# Altium schematic sheet IO_Devices.SchDoc
size A; SheetNumber: 4; SheetTotal: 5
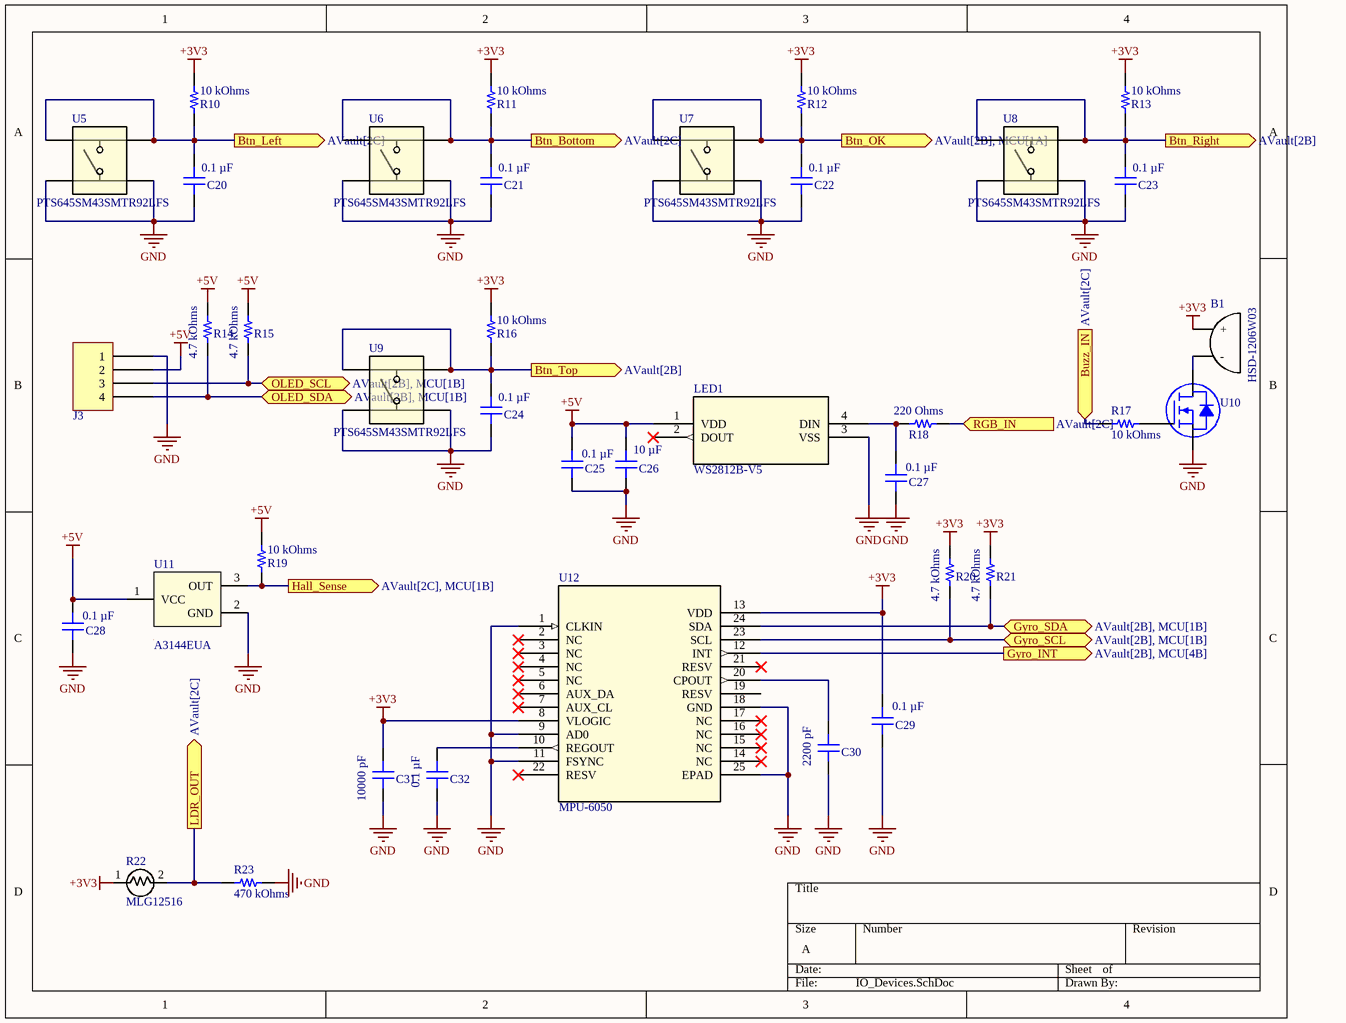
[diagram p0: IO_Devices.SchDoc]

## Parts
B1  HSD-1206W03  [HSD-1206W03]
C20  0.1 µF  [CAP 0603_1608]
C21  0.1 µF  [CAP 0603_1608]
C22  0.1 µF  [CAP 0603_1608]
C23  0.1 µF  [CAP 0603_1608]
C24  0.1 µF  [CAP 0603_1608]
C25  0.1 µF  [CAP 0603_1608]
C26  10 µF  [CAP 0805_2012]
C27  0.1 µF  [CAP 0603_1608]
C28  0.1 µF  [CAP 0603_1608]
C29  0.1 µF  [CAP 0603_1608]
C30  2200 pF  [CAP 0603_1608]
C31  10000 pF  [CAP 0603_1608]
C32  0.1 µF  [CAP 0603_1608]
J3  0022272041  [MOLEX KK 0022272041]  (value not drawn)
LED1  WS2812B-V5  [WS2812B-V5]
R10  10 kOhms  [RES 0805_2012]
R11  10 kOhms  [RES 0805_2012]
R12  10 kOhms  [RES 0805_2012]
R13  10 kOhms  [RES 0805_2012]
R14  4.7 kOhms  [RES 0805_2012]
R15  4.7 kOhms  [RES 0805_2012]
R16  10 kOhms  [RES 0805_2012]
R17  10 kOhms  [RES 0805_2012]
R18  220 Ohms  [RES 0603_1608]
R19  10 kOhms  [RES 0805_2012]
R20  4.7 kOhms  [RES 0805_2012]
R21  4.7 kOhms  [RES 0805_2012]
R22  MLG12516  [MLG12516]
R23  470 kOhms  [RES 0805_2012]
U5  PTS645SM43SMTR92LFS  [SWITCH_43SMTR92LFS]
U6  PTS645SM43SMTR92LFS  [SWITCH_43SMTR92LFS]
U7  PTS645SM43SMTR92LFS  [SWITCH_43SMTR92LFS]
U8  PTS645SM43SMTR92LFS  [SWITCH_43SMTR92LFS]
U9  PTS645SM43SMTR92LFS  [SWITCH_43SMTR92LFS]
U10  2N7002A-7  [DIODES SOT-23-3]  (value not drawn)
U11  A3144EUA  [A3144EUA]
U12  MPU-6050  [QFN24_4X4X0P9-0P5_TDK]

## Ports
Btn_Bottom (out, see AVault[2C]), Btn_Left (out, see AVault[2C]), Btn_OK (out, see AVault[2B], MCU[1A]), Btn_Right (out, see AVault[2B]), Btn_Top (out, see AVault[2B]), Buzz_IN (in, see AVault[2C]), Gyro_INT (out, see AVault[2B], MCU[4B]), Gyro_SCL (bidir, see AVault[2B], MCU[1B]), Gyro_SDA (bidir, see AVault[2B], MCU[1B]), Hall_Sense (out, see AVault[2C], MCU[1B]), LDR_OUT (out, see AVault[2C]), OLED_SCL (bidir, see AVault[2B], MCU[1B]), OLED_SDA (bidir, see AVault[2B], MCU[1B]), RGB_IN (in, see AVault[2C])

## Nets
+3V3: B1.1(+) C29.2 C31.2 R10.2 R11.2 R12.2 R13.2 R16.2 R20.2 R21.2 R22.1 U12.8(VLOGIC) U12.13(VDD)
+5V: C25.2 C26.2 C28.2 J3.2 LED1.1(VDD) R14.2 R15.2 R19.2 U11.1(VCC)
GND: C20.1 C21.1 C22.1 C23.1 C24.1 C25.1 C26.1 C27.1 C28.1 C29.1 C30.1 C31.1 C32.1 J3.1 LED1.3(VSS) R23.1 U5.3 U5.4 U6.3 U6.4 U7.3 U7.4 U8.3 U8.4 U9.3 U9.4 U10.2(S) U11.2(GND) U12.1(CLKIN) U12.9(AD0) U12.11(FSYNC) U12.18(GND) U12.25(EPAD)
Btn_Bottom: C21.2 R11.1 U6.1 U6.2 ; port Btn_Bottom
Btn_Left: C20.2 R10.1 U5.1 U5.2 ; port Btn_Left
Btn_OK: C22.2 R12.1 U7.1 U7.2 ; port Btn_OK
Btn_Right: C23.2 R13.1 U8.1 U8.2 ; port Btn_Right
Btn_Top: C24.2 R16.1 U9.1 U9.2 ; port Btn_Top
Buzz_IN: R17.2 ; port Buzz_IN
Gyro_INT: U12.12(INT) ; port Gyro_INT
Gyro_SCL: R20.1 U12.23(SCL) ; port Gyro_SCL
Gyro_SDA: R21.1 U12.24(SDA) ; port Gyro_SDA
Hall_Sense: R19.1 U11.3(OUT) ; port Hall_Sense
LDR_OUT: R22.2 R23.2 ; port LDR_OUT
OLED_SCL: J3.3 R15.1 ; port OLED_SCL
OLED_SDA: J3.4 R14.1 ; port OLED_SDA
RGB_IN: R18.1 ; port RGB_IN
NetB1_2: B1.2(-) U10.3(D)
NetC27_2: C27.2 LED1.4(DIN) R18.2
NetC30_2: C30.2 U12.20(CPOUT)
NetC32_2: C32.2 U12.10(REGOUT)
NetR17_1: R17.1 U10.1(G)

Not connected (* = marked no-connect by the designer): LED1 2(DOUT)*; U12 2(NC)* 3(NC)* 4(NC)* 5(NC)* 6(AUX_DA)* 7(AUX_CL)* 14(NC)* 15(NC)* 16(NC)* 17(NC)* 19(RESV) 21(RESV)* 22(RESV)*

## Library data of the parts
B1 = HSD-1206W03: BUZZER MAGNETIC 3V 12MM TH
C20-C25 C27-C29 C32 = GRM188R72A104KA35D: CAP CER 0.1UF 100V X7R 0603; Manufacturer: Murata Electronics; id: 1738; Tolerance: ±10%; Part Number: GRM188R72A104KA35D; Value: 0.1 µF; Temperature Coefficient: X7R; Supplier Part Number 1: 490-3285-1-ND; ComponentLink2Description: DigiKey Link; ComponentLink1URL: https:\\www.murata.com\~\media\webrenewal\support\library\catalog\products\capacitor\mlcc\c02e.ashx?la=en-us; PartId: 9563; Supplier 1: DigiKey; Series: GRM; LastUpdated: 2023-01-03T20:07:27.117; Part Status: Active; Capacitance: 0.1 µF; Device Package: 0603 (1608 Metric); Thickness (Max): 0.035" (0.90mm); Voltage - Rated: 100V; Minimum Order: 1; Packaging: TapeAndReel; Applications: General Purpose; Package / Case: 0603 (1608 Metric); ComponentLink1Description: Datasheet; Price: 0.02; ComponentLink2URL: https:\\www.digikey.com\en\products\detail\murata-electronics\GRM188R72A104KA35D\702549; Lifecycle Status: Active; Operating Temperature: -55°C ~ 125°C; Size / Dimension: 0.063" L x 0.031" W (1.60mm x 0.80mm); Mounting Type: Surface Mount, MLCC
C26 = C2012X5R1V106K125AC: CAP CER 10UF 35V X5R 0805; Manufacturer: TDK Corporation; id: 6404; Tolerance: ±10%; Value: 10 µF; Temperature Coefficient: X5R; Part Number: C2012X5R1V106K125AC; Supplier Part Number 1: 445-14418-1-ND; ComponentLink2Description: DigiKey Link; Features: Low ESL; ComponentLink1URL: https:\\product.tdk.com\info\en\catalog\datasheets\mlcc_commercial_general_en.pdf?ref_disty=digikey; PartId: 40531; Supplier 1: DigiKey; Series: C; LastUpdated: 2023-01-03T20:10:34.680; Part Status: Active; Capacitance: 10 µF; Device Package: 0805 (2012 Metric); Thickness (Max): 0.057" (1.45mm); Voltage - Rated: 35V; Minimum Order: 1; Packaging: TapeAndReel; Applications: General Purpose; Package / Case: 0805 (2012 Metric); ComponentLink1Description: Datasheet; Price: 0.14; ComponentLink2URL: https:\\www.digikey.com\en\products\detail\tdk-corporation\C2012X5R1V106K125AC\3951654; Lifecycle Status: Active; Operating Temperature: -55°C ~ 85°C; Size / Dimension: 0.079" L x 0.049" W (2.00mm x 1.25mm); Mounting Type: Surface Mount, MLCC
C30 = C1608NP02A222J080AA: CAP CER 2200PF 100V NP0 0603; Manufacturer: TDK Corporation; id: 7609; Temperature Coefficient: C0G, NP0; Tolerance: ±5%; Part Number: C1608NP02A222J080AA; Value: 2200 pF; Supplier Part Number 1: 445-15272-1-ND; ComponentLink2Description: DigiKey Link; Features: High Temperature; ComponentLink1URL: https:\\product.tdk.com\info\en\catalog\datasheets\mlcc_commercial_hightemp_en.pdf?ref_disty=digikey; PartId: 40621; Supplier 1: DigiKey; Series: C; LastUpdated: 2023-01-03T20:07:16.653; Part Status: Active; Capacitance: 2200 pF; Device Package: 0603 (1608 Metric); Thickness (Max): 0.035" (0.90mm); Voltage - Rated: 100V; Minimum Order: 1; Packaging: TapeAndReel; Applications: General Purpose; Package / Case: 0603 (1608 Metric); ComponentLink1Description: Datasheet; Price: 0.04; ComponentLink2URL: https:\\www.digikey.com\en\products\detail\tdk-corporation\C1608NP02A222J080AA\4278005; Lifecycle Status: Active; Operating Temperature: -55°C ~ 150°C; Size / Dimension: 0.063" L x 0.031" W (1.60mm x 0.80mm); Mounting Type: Surface Mount, MLCC
C31 = C1608NP01H103J080AA: CAP CER 10000PF 50V NP0 0603; Manufacturer: TDK Corporation; id: 2977; Temperature Coefficient: C0G, NP0; Tolerance: ±5%; Part Number: C1608NP01H103J080AA; Value: 10000 pF; Supplier Part Number 1: 445-14056-1-ND; ComponentLink2Description: DigiKey Link; Features: High Temperature; ComponentLink1URL: https:\\product.tdk.com\info\en\catalog\datasheets\mlcc_commercial_hightemp_en.pdf?ref_disty=digikey; PartId: 14361; Supplier 1: DigiKey; Series: C; LastUpdated: 2023-01-03T20:07:13.587; Part Status: Active; Capacitance: 10000 pF; Device Package: 0603 (1608 Metric); Thickness (Max): 0.035" (0.90mm); Voltage - Rated: 50V; Minimum Order: 1; Packaging: TapeAndReel; Applications: General Purpose; Package / Case: 0603 (1608 Metric); ComponentLink1Description: Datasheet; Price: 0.07; ComponentLink2URL: https:\\www.digikey.com\en\products\detail\tdk-corporation\C1608NP01H103J080AA\3951292; Lifecycle Status: Active; Operating Temperature: -55°C ~ 150°C; Size / Dimension: 0.063" L x 0.031" W (1.60mm x 0.80mm); Mounting Type: Surface Mount, MLCC
J3 = 0022272041: CONN HEADER VERT 4POS 2.54MM; Manufacturer: Molex; id: 78; Style: Board to Cable\Wire; Contact Length - Mating: 0.295" (7.49mm); Pitch - Mating: 0.100" (2.54mm); Number Of Positions: 4; Number Of Positions Loaded: All; Shrouding: Shrouded - 1 Wall; Material Flammability Rating: UL94 V-0; Overall Contact Length: 0.560" (14.22mm); Contact Length - Post: 0.140" (3.56mm); Part Number: 0022272041; Supplier Part Number 1: WM4113-ND; Contact Shape: Square; Termination: Solder; ComponentLink1Description: Datasheet; Connector Type: Header; Contact Material: Brass; ComponentLink2URL: http:\\digikey.com\product-detail\en\molex\0022272041\WM4113-ND\1130579; Contact Finish - Mating: Tin; ComponentLink1URL: https:\\www.molex.com\pdm_docs\sd\022272041_sd.pdf; Fastening Type: Friction Lock; Supplier 1: DigiKey; Number Of Rows: 1; Series: KK 6410; Part Status: Active; ComponentLink2Description: DigiKey Link; Contact Type: Male Pin; Packaging: Bulk; Insulation Height: 0.461" (11.70mm); Contact Finish - Post: Tin; Contact Finish Thickness - Mating: 100.0µin (2.54µm); Minimum Order: 1; PartId: 78; Lifecycle Status: Active; LastUpdated: 2020-01-12T23:52:05.287; Insulation Color: Natural; Mounting Type: Through Hole; Insulation Material: Polyamide (PA), Nylon; Price: 0.40
LED1 = WS2812B-V5: ADDRESS LED RED/GRN/BLUE; Manufacturer_Name: Sparkfun; Manufacturer_Part_Number: COM-16347; Type: LED Addressable; Copyright: Copyright (C) 2026 Ultra Librarian. All rights reserved.; RefDes: RefDes
R10-R13 R16 R17 R19 = RNCP0805FTD10K0: RES 10K OHM 1% 1\4W 0805; Manufacturer: Stackpole Electronics Inc; id: 164; Temperature Coefficient: ±100ppm\°C; Power (Watts): 0.25W, 1\4W; Part Number: RNCP0805FTD10K0; Height - Seated (Max): 0.025" (0.65mm); Supplier Part Number 1: RNCP0805FTD10K0CT-ND; Supplier Device Package: 0805; ComponentLink1Description: Datasheet; ComponentLink2URL: https:\\www.digikey.com\en\products\detail\stackpole-electronics-inc\RNCP0805FTD10K0\2240262; Features: Anti-Sulfur; ComponentLink1URL: https:\\www.seielect.com\catalog\sei-rncp.pdf; Composition: Thin Film; Tolerance: ±1%; Supplier 1: DigiKey; Series: RNCP; Part Status: Active; ComponentLink2Description: DigiKey Link; Device Package: 0805 (2012 Metric); Packaging: TapeAndReel; Minimum Order: 1; Package / Case: 0805 (2012 Metric); PartId: 28021; Lifecycle Status: Active; LastUpdated: 2023-01-02T20:44:50.960; Operating Temperature: -55°C ~ 155°C; Number Of Terminations: 2; Value: 10 kOhms; Size / Dimension: 0.079" L x 0.049" W (2.00mm x 1.25mm); Price: 0.01; Resistance: 10 kOhms
R14 R15 R20 R21 = RMCF0805FT4K70: RES 4.7K OHM 1% 1\8W 0805; Manufacturer: Stackpole Electronics Inc; id: 2365; Temperature Coefficient: ±100ppm\°C; Power (Watts): 0.125W, 1\8W; Part Number: RMCF0805FT4K70; Height - Seated (Max): 0.026" (0.65mm); Supplier Part Number 1: RMCF0805FT4K70CT-ND; Supplier Device Package: 0805; ComponentLink1Description: Datasheet; ComponentLink2URL: https:\\www.digikey.com\en\products\detail\stackpole-electronics-inc\RMCF0805FT4K70\1760659; Features: Automotive AEC-Q200; ComponentLink1URL: https:\\www.seielect.com\catalog\sei-rmcf_rmcp.pdf; Composition: Thick Film; Tolerance: ±1%; Supplier 1: DigiKey; Series: RMCF; Part Status: Active; ComponentLink2Description: DigiKey Link; Device Package: 0805 (2012 Metric); Packaging: CutTape; Ratings: AEC-Q200; Minimum Order: 1; Package / Case: 0805 (2012 Metric); PartId: 32422; Lifecycle Status: Active; LastUpdated: 2023-01-02T20:44:32.783; Operating Temperature: -55°C ~ 155°C; Number Of Terminations: 2; Value: 4.7 kOhms; Size / Dimension: 0.079" L x 0.049" W (2.00mm x 1.25mm); Price: 0.01; Resistance: 4.7 kOhms
R18 = RMCF0603FT220R: RES 220 OHM 1% 1\10W 0603; Manufacturer: Stackpole Electronics Inc; id: 593; Temperature Coefficient: ±100ppm\°C; Power (Watts): 0.1W, 1\10W; Part Number: RMCF0603FT220R; Height - Seated (Max): 0.022" (0.55mm); Supplier Part Number 1: RMCF0603FT220RCT-ND; Supplier Device Package: 0603; ComponentLink1Description: Datasheet; ComponentLink2URL: https:\\www.digikey.com\en\products\detail\stackpole-electronics-inc\RMCF0603FT220R\1760809; Features: Automotive AEC-Q200; ComponentLink1URL: https:\\www.seielect.com\catalog\sei-rmcf_rmcp.pdf; Composition: Thick Film; Tolerance: ±1%; Supplier 1: DigiKey; Series: RMCF; Part Status: Active; ComponentLink2Description: DigiKey Link; Device Package: 0603 (1608 Metric); Packaging: CutTape; Ratings: AEC-Q200; Minimum Order: 1; Package / Case: 0603 (1608 Metric); PartId: 6086; Lifecycle Status: Active; LastUpdated: 2023-01-02T20:30:22.033; Operating Temperature: -55°C ~ 155°C; Number Of Terminations: 2; Value: 220 Ohms; Size / Dimension: 0.061" L x 0.031" W (1.55mm x 0.80mm); Price: 0.01; Resistance: 220 Ohms
R22 = MLG12516: CDS PHOTORESISTOR
R23 = CRGP0805F470K: RES 470K OHM 1% 1\3W 0805; Manufacturer: TE Connectivity Passive Product; id: 531; Temperature Coefficient: ±100ppm\°C; Power (Watts): 0.333W, 1\3W; Part Number: CRGP0805F470K; Height - Seated (Max): 0.026" (0.65mm); Supplier Part Number 1: A130509CT-ND; Supplier Device Package: 0805; ComponentLink1Description: Datasheet; ComponentLink2URL: https:\\www.digikey.com\en\products\detail\te-connectivity-passive-product\CRGP0805F470K\8577111; Features: Pulse Withstanding; ComponentLink1URL: https:\\www.te.com\commerce\DocumentDelivery\DDEController?Action=srchrtrv&DocNm=9-1773463-9&DocType=DS&DocLang=English; Composition: Thick Film; Tolerance: ±1%; Supplier 1: DigiKey; Series: CRGP; Part Status: Active; ComponentLink2Description: DigiKey Link; Device Package: 0805 (2012 Metric); Packaging: TapeAndReel; Minimum Order: 1; Package / Case: 0805 (2012 Metric); PartId: 28755; Lifecycle Status: Active; LastUpdated: 2023-01-02T20:44:47.733; Operating Temperature: -55°C ~ 155°C; Number Of Terminations: 2; Value: 470 kOhms; Size / Dimension: 0.079" L x 0.049" W (2.00mm x 1.25mm); Price: 0.02; Resistance: 470 kOhms
U5-U9 = PTS645SM43SMTR92LFS: Description; Manufacturer_Name: C&K Components; Copyright: Copyright (C) 2026 Ultra Librarian. All rights reserved.; Manufacturer_Part_Number: PTS645SM43SMTR92LFS; RefDes: RefDes; Type: Type
U10 = 2N7002A-7: MOSFET N-CH 60V 180MA SOT23; Manufacturer: Diodes Incorporated; id: 68; FET Type: N-Channel; Drive Voltage (Max Rds On,  Min Rds On): 5V, 10V; Power Dissipation (Max): 370mW (Ta); Vgs (Max): ±20V; Input Capacitance (Ciss) (Max) @ Vds: 23 pF @ 25 V; Current - Continuous Drain (Id) @ 25°C: 180mA (Ta); Rds On (Max) @ Id, Vgs: 6Ohm @ 115mA, 5V; Vgs(Th) (Max) @ Id: 2V @ 250µA; Part Number: 2N7002A-7; Supplier Part Number 1: 2N7002A-7DICT-ND; Supplier Device Package: SOT-23-3; ComponentLink1Description: Datasheet; ComponentLink2URL: https:\\www.digikey.com\en\products\detail\diodes-incorporated\2N7002A-7\3451498; ComponentLink1URL: https:\\www.diodes.com\assets\Datasheets\ds31360.pdf; Supplier 1: DigiKey; Series: -; Part Status: Active; ComponentLink2Description: DigiKey Link; Packaging: TapeAndReel; Minimum Order: 1; Drain To Source Voltage (Vdss): 60 V; Package / Case: TO-236-3, SC-59, SOT-23-3; Lifecycle Status: Active; LastUpdated: 2023-01-02T21:04:51.983; Technology: MOSFET (Metal Oxide); Operating Temperature: -55°C ~ 150°C (TJ); Mounting Type: Surface Mount; Price: 0.05
U11 = A3144EUA: Digital Switch Unipolar Switch Current Source Hall Effect 3-SIP; Manufacturer Name: Allegro Microsystems; Manufacturer Part Number: A3144EUA
U12 = MPU-6050: Description; Manufacturer_Name: TDK; Type: Motion Sensors; Copyright: Copyright (C) 2025 Ultra Librarian. All rights reserved.; Manufacturer_Part_Number: MPU-6050; RefDes: RefDes